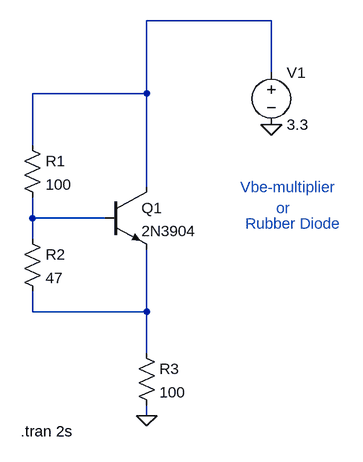
[diagram p0: schematic vbe-multiplier.asc]
vbe-multiplier.asc, the LTspice schematic file:
Version 4
SHEET 1 880 680
WIRE 416 -144 224 -144
WIRE 416 -64 416 -144
WIRE 224 -32 224 -144
WIRE 224 -32 48 -32
WIRE 48 48 48 -32
WIRE 224 112 224 -32
WIRE 48 160 48 128
WIRE 160 160 48 160
WIRE 48 192 48 160
WIRE 48 304 48 272
WIRE 224 304 224 208
WIRE 224 304 48 304
WIRE 224 368 224 304
WIRE 224 464 224 448
FLAG 416 16 0
FLAG 224 464 0
DATAFLAG 224 304 ""
DATAFLAG 224 -32 ""
DATAFLAG 48 160 ""
SYMBOL npn 160 112 R0
SYMATTR InstName Q1
SYMATTR Value 2N3904
SYMBOL res 32 32 R0
SYMATTR InstName R1
SYMATTR Value 100
SYMBOL res 32 176 R0
SYMATTR InstName R2
SYMATTR Value 47
SYMBOL voltage 416 -80 R0
SYMATTR InstName V1
SYMATTR Value 3.3
SYMBOL res 208 352 R0
SYMATTR InstName R3
SYMATTR Value 100
TEXT 30 488 Left 2 !.tran 2s
TEXT 368 112 Left 2 ;Vbe-multiplier
TEXT 376 168 Left 2 ;Rubber Diode
TEXT 424 144 Left 2 ;or

The netlist it stands for:
* vbe-multiplier.asc
Q1 N001 N002 N003 0 2N3904
R1 N001 N002 100
R2 N002 N003 47
V1 N001 0 3.3
R3 N003 0 100
.model NPN NPN
.model PNP PNP
.lib standard.bjt
.tran 2s
* Vbe-multiplier
* Rubber Diode
* or
.backanno
.end